# Altium schematic sheet 1.DSP.SchDoc
size A3; Date: 2019/03/06; Author: ZhangPan; Revision: 2.0; SheetNumber: 1; SheetTotal: 4; Size: A4; Contact: 0731-88731029
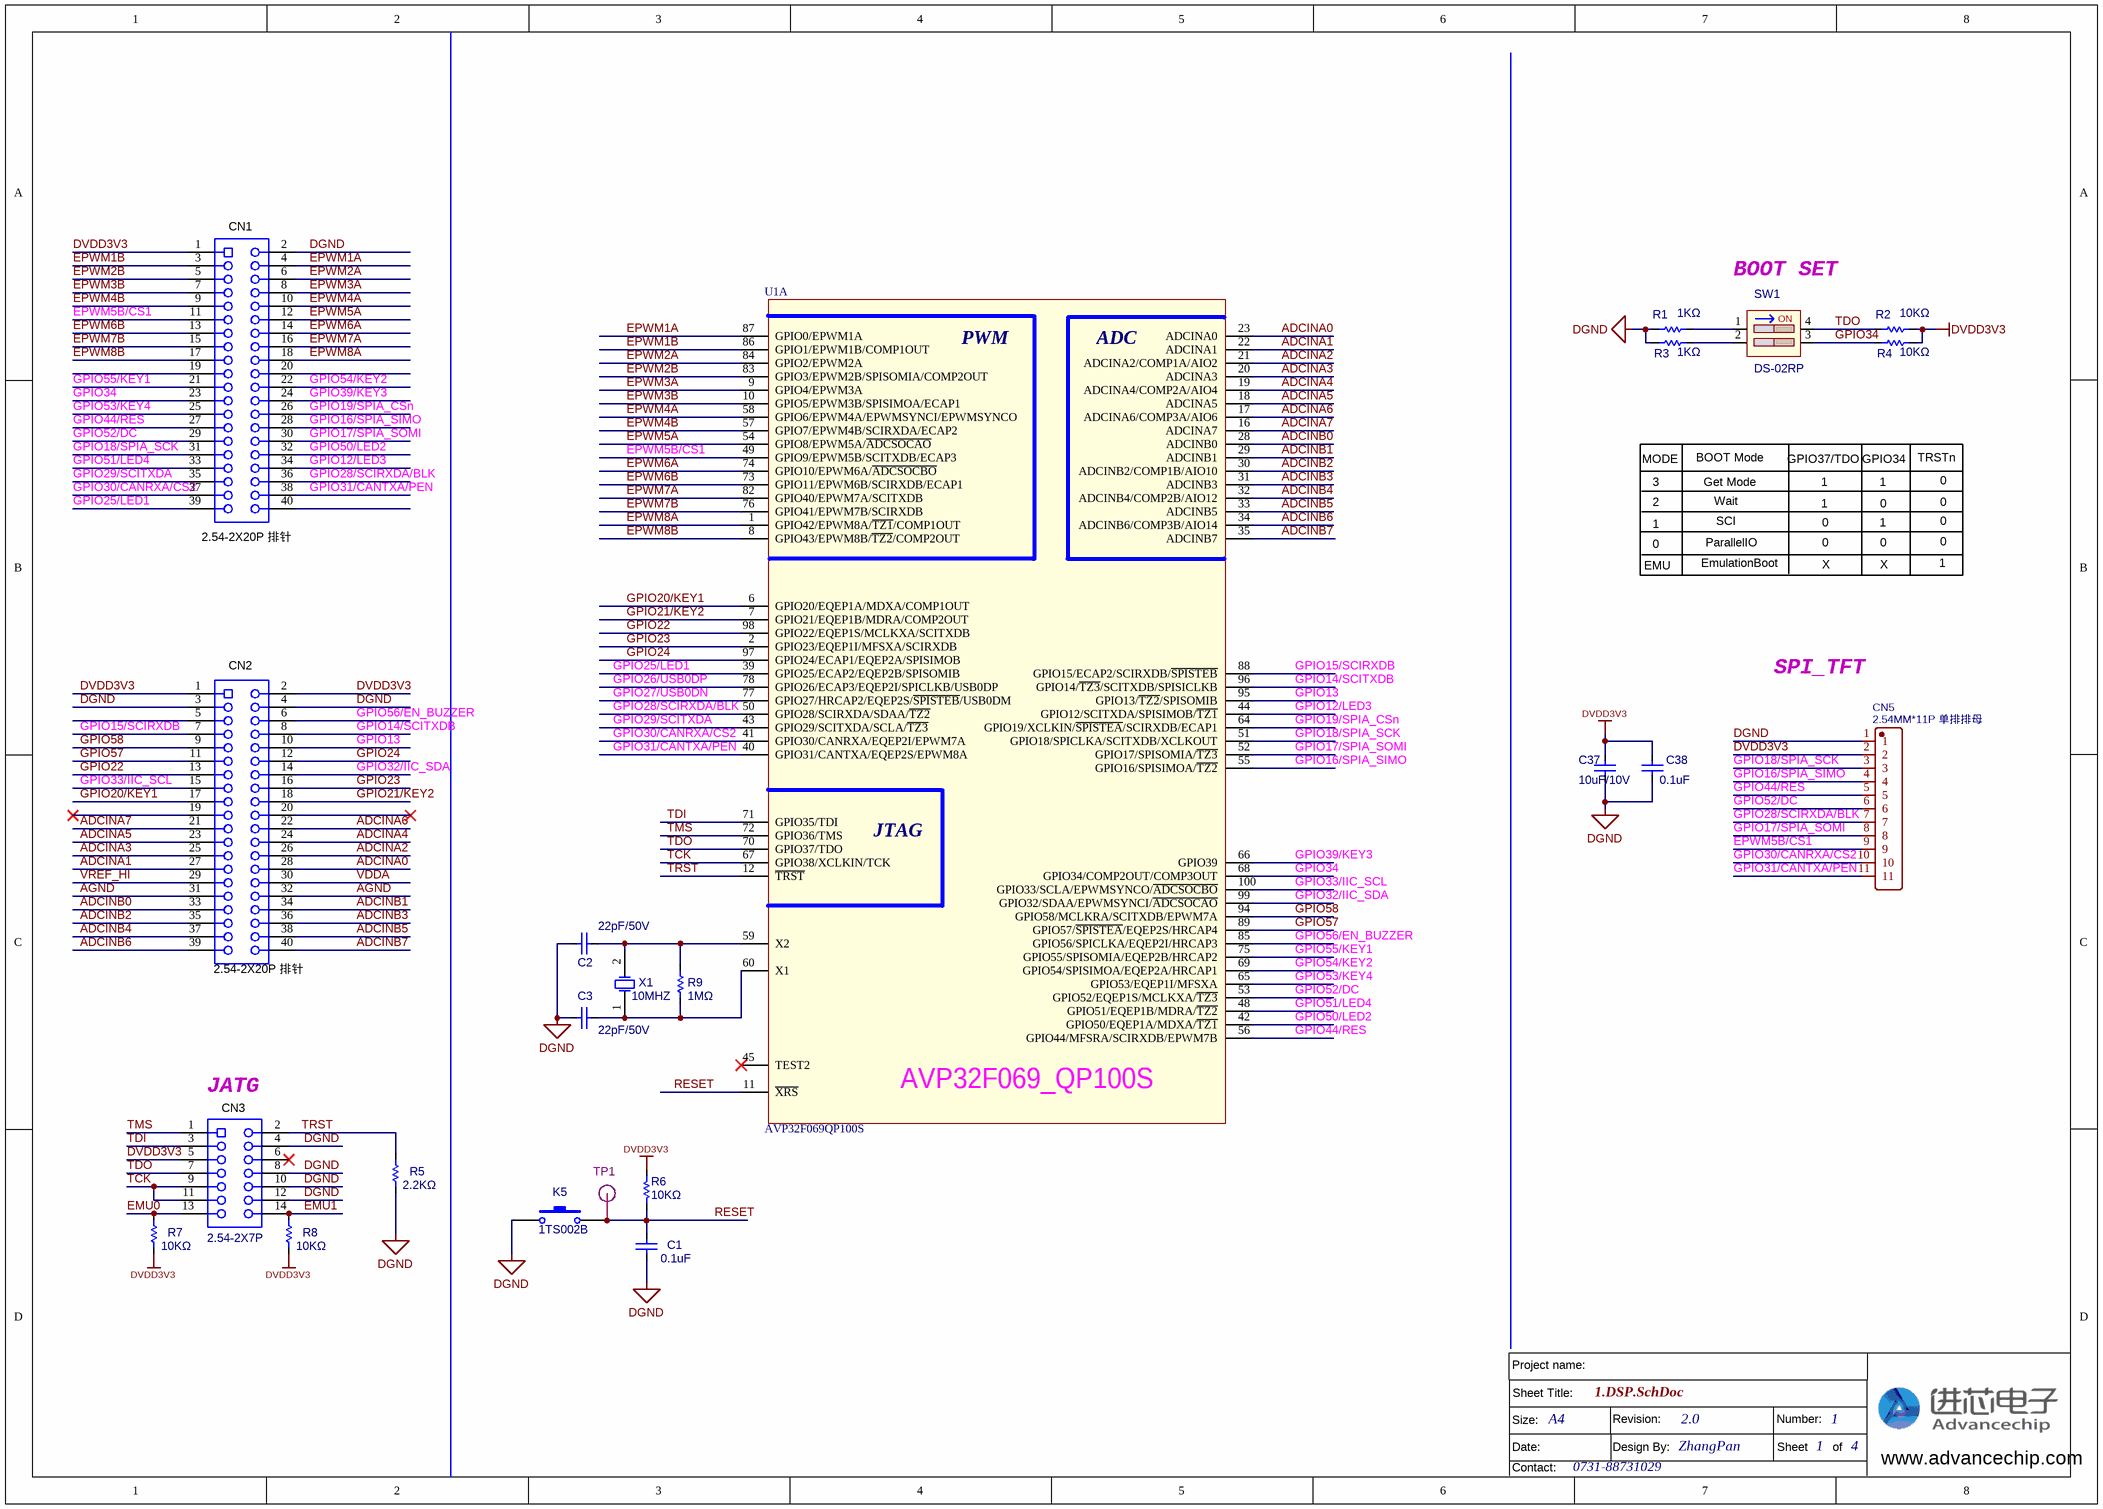
[diagram p0: 1.DSP.SchDoc]

## Parts
C1  value 0.1uF  [C0603]  (hidden comment: 0.1uF/50V)
C2  22pF/50V  [C0603]
C3  22pF/50V  [C0603]
C37  10uF/10V  [C0805]
C38  value 0.1uF  [C0603]  (hidden comment: 0.1uF/50V)
CN1  2.54-2X20P 排针  [IDC2X20]
CN2  2.54-2X20P 排针  [IDC2X20]
CN3  value 2.54-2X7P  [IDC14-L]  (hidden comment: 2.54-2X7P 简易牛角母座)
CN5  2.54MM*11P 单排排母  [SIP11_TFT]
K5  value 1TS002B  [SW-3X6]  (hidden comment: 1TS002B-2400-5001-CT)
R1  1KΩ  [R0603]
R2  10KΩ  [R0603]
R3  1KΩ  [R0603]
R4  10KΩ  [R0603]
R5  2.2KΩ  [R0603]
R6  10KΩ  [R0603]
R7  10KΩ  [R0603]
R8  10KΩ  [R0603]
R9  1MΩ  [R0603]
SW1  DS-02RP  [DIP-KEY-2]
TP1  RST  [TEST-0.8/1.5MM]  (value not drawn)
U1  AVP32F069QP100S  [LQFP-100]  (part A of 2)
X1  value 10MHZ  [XTAL_5032]  (hidden comment: YSX530GA 10MHZ 20pF 10ppm)

## Nets
DGND: C1.2 C2.2 C3.1 C37.2 C38.2 CN1.2 CN2.3 CN2.4 CN3.4 CN3.8 CN3.10 CN3.12 CN5.1 K5.2 R1.1 R3.1 R5.1
DVDD3V3: C37.1 C38.1 CN1.1 CN2.1 CN2.2 CN3.5 CN5.2 R2.2 R4.2 R6.1 R7.1 R8.1
ADCINA0: CN2.28 U1.23(ADCINA0)
ADCINA1: CN2.27 U1.22(ADCINA1)
ADCINA2: CN2.26 U1.21(ADCINA2/COMP1A/AIO2)
ADCINA3: CN2.25 U1.20(ADCINA3)
ADCINA4: CN2.24 U1.19(ADCINA4/COMP2A/AIO4)
ADCINA5: CN2.23 U1.18(ADCINA5)
ADCINA6: CN2.22 U1.17(ADCINA6/COMP3A/AIO6)
ADCINA7: CN2.21 U1.16(ADCINA7)
ADCINB0: CN2.33 U1.28(ADCINB0)
ADCINB1: CN2.34 U1.29(ADCINB1)
ADCINB2: CN2.35 U1.30(ADCINB2/COMP1B/AIO10)
ADCINB3: CN2.36 U1.31(ADCINB3)
ADCINB4: CN2.37 U1.32(ADCINB4/COMP2B/AIO12)
ADCINB5: CN2.38 U1.33(ADCINB5)
ADCINB6: CN2.39 U1.34(ADCINB6/COMP3B/AIO14)
ADCINB7: CN2.40 U1.35(ADCINB7)
AGND: CN2.31 CN2.32
EMU0: CN3.13 R7.2
EMU1: CN3.14 R8.2
EPWM1A: CN1.4 U1.87(GPIO0/EPWM1A)
EPWM1B: CN1.3 U1.86(GPIO1/EPWM1B/COMP1OUT)
EPWM2A: CN1.6 U1.84(GPIO2/EPWM2A)
EPWM2B: CN1.5 U1.83(GPIO3/EPWM2B/SPISOMIA/COMP2OUT)
EPWM3A: CN1.8 U1.9(GPIO4/EPWM3A)
EPWM3B: CN1.7 U1.10(GPIO5/EPWM3B/SPISIMOA/ECAP1)
EPWM4A: CN1.10 U1.58(GPIO6/EPWM4A/EPWMSYNCI/EPWMSYNCO)
EPWM4B: CN1.9 U1.57(GPIO7/EPWM4B/SCIRXDA/ECAP2)
EPWM5A: CN1.12 U1.54(GPIO8/EPWM5A/~{ADCSOCAO})
EPWM5B/CS1: CN1.11 CN5.9 U1.49(GPIO9/EPWM5B/SCITXDB/ECAP3)
EPWM6A: CN1.14 U1.74(GPIO10/EPWM6A/~{ADCSOCBO})
EPWM6B: CN1.13 U1.73(GPIO11/EPWM6B/SCIRXDB/ECAP1)
EPWM7A: CN1.16 U1.82(GPIO40/EPWM7A/SCITXDB)
EPWM7B: CN1.15 U1.76(GPIO41/EPWM7B/SCIRXDB)
EPWM8A: CN1.18 U1.1(GPIO42/EPWM8A/~{TZ1}/COMP1OUT)
EPWM8B: CN1.17 U1.8(GPIO43/EPWM8B/~{TZ2}/COMP2OUT)
GPIO12/LED3: CN1.34 U1.44(GPIO12/SCITXDA/SPISIMOB/~{TZ1})
GPIO13: CN2.10 U1.95(GPIO13/~{TZ2}/SPISOMIB)
GPIO14/SCITXDB: CN2.8 U1.96(GPIO14/~{TZ3}/SCITXDB/SPISICLKB)
GPIO15/SCIRXDB: CN2.7 U1.88(GPIO15/ECAP2/SCIRXDB/~{SPISTEB})
GPIO16/SPIA_SIMO: CN1.28 CN5.4 U1.55(GPIO16/SPISIMOA/~{TZ2})
GPIO17/SPIA_SOMI: CN1.30 CN5.8 U1.52(GPIO17/SPISOMIA/~{TZ3})
GPIO18/SPIA_SCK: CN1.31 CN5.3 U1.51(GPIO18/SPICLKA/SCITXDB/XCLKOUT)
GPIO19/SPIA_CSn: CN1.26 U1.64(GPIO19/XCLKIN/~{SPISTEA}/SCIRXDB/ECAP1)
GPIO20/KEY1: CN2.17 U1.6(GPIO20/EQEP1A/MDXA/COMP1OUT)
GPIO21/KEY2: CN2.18 U1.7(GPIO21/EQEP1B/MDRA/COMP2OUT)
GPIO22: CN2.13 U1.98(GPIO22/EQEP1S/MCLKXA/SCITXDB)
GPIO23: CN2.16 U1.2(GPIO23/EQEP1I/MFSXA/SCIRXDB)
GPIO24: CN2.12 U1.97(GPIO24/ECAP1/EQEP2A/SPISIMOB)
GPIO25/LED1: CN1.39 U1.39(GPIO25/ECAP2/EQEP2B/SPISOMIB)
GPIO26/USB0DP: U1.78(GPIO26/ECAP3/EQEP2I/SPICLKB/USB0DP)
GPIO27/USB0DN: U1.77(GPIO27/HRCAP2/EQEP2S/~{SPISTEB}/USB0DM)
GPIO28/SCIRXDA/BLK: CN1.36 CN5.7 U1.50(GPIO28/SCIRXDA/SDAA/~{TZ2})
GPIO29/SCITXDA: CN1.35 U1.43(GPIO29/SCITXDA/SCLA/~{TZ3})
GPIO30/CANRXA/CS2: CN1.37 CN5.10 U1.41(GPIO30/CANRXA/EQEP2I/EPWM7A)
GPIO31/CANTXA/PEN: CN1.38 CN5.11 U1.40(GPIO31/CANTXA/EQEP2S/EPWM8A)
GPIO32/IIC_SDA: CN2.14 U1.99(GPIO32/SDAA/EPWMSYNCI/~{ADCSOCAO})
GPIO33/IIC_SCL: CN2.15 U1.100(GPIO33/SCLA/EPWMSYNCO/~{ADCSOCBO})
GPIO34: CN1.23 R4.1 SW1.3 U1.68(GPIO34/COMP2OUT/COMP3OUT)
GPIO39/KEY3: CN1.24 U1.66(GPIO39)
GPIO44/RES: CN1.27 CN5.5 U1.56(GPIO44/MFSRA/SCIRXDB/EPWM7B)
GPIO50/LED2: CN1.32 U1.42(GPIO50/EQEP1A/MDXA/~{TZ1})
GPIO51/LED4: CN1.33 U1.48(GPIO51/EQEP1B/MDRA/~{TZ2})
GPIO52/DC: CN1.29 CN5.6 U1.53(GPIO52/EQEP1S/MCLKXA/~{TZ3})
GPIO53/KEY4: CN1.25 U1.65(GPIO53/EQEP1I/MFSXA)
GPIO54/KEY2: CN1.22 U1.69(GPIO54/SPISIMOA/EQEP2A/HRCAP1)
GPIO55/KEY1: CN1.21 U1.75(GPIO55/SPISOMIA/EQEP2B/HRCAP2)
GPIO56/EN_BUZZER: CN2.6 U1.85(GPIO56/SPICLKA/EQEP2I/HRCAP3)
GPIO57: CN2.11 U1.89(GPIO57/~{SPISTEA}/EQEP2S/HRCAP4)
GPIO58: CN2.9 U1.94(GPIO58/MCLKRA/SCITXDB/EPWM7A)
RESET: C1.1 K5.1 R6.2 TP1.1 U1.11(~{XRS})
TCK: CN3.9 CN3.11 U1.67(GPIO38/XCLKIN/TCK)
TDI: CN3.3 U1.71(GPIO35/TDI)
TDO: CN3.7 R2.1 SW1.4 U1.70(GPIO37/TDO)
TMS: CN3.1 U1.72(GPIO36/TMS)
TRST: CN3.2 R5.2 U1.12(~{TRST})
VDDA: CN2.30
VREF_HI: CN2.29
NetC2_1: C2.1 R9.1 U1.59(X2) X1.2(OSC2)
NetC3_2: C3.2 R9.2 U1.60(X1) X1.1(OSC1)
NetR1_2: R1.2 SW1.1
NetR3_2: R3.2 SW1.2

Not connected (* = marked no-connect by the designer): CN1 19 20 40; CN2 5 19* 20*; CN3 6*; U1 45(TEST2)*

## Notes on the sheet
- BOOT SET
- BOOT Mode
- TRSTn
- 3
- 2
- 1
- MODE
- Wait
- SCI
- Get Mode
- GPIO37/TDO
- 0
- GPIO34
- EMU
- ParallelIO
- EmulationBoot
- X
- SPI_TFT
- (near CN3) JATG
- Sheet Title:
- Project name:
- Size:
- Date:
- Contact:
- Revision:
- Design By:
- Number:
- Sheet       of
- www.advancechip.com
- (in symbol AVP32F069QP100S, part A) PWM; ADC; JTAG; AVP32F069_QP100S
- (in symbol SW-2B) ON

## Library data of the parts
C1 C37 C38 = Cap: 贴片电容; Published: 8-Jun-2000; LatestRevisionDate: 17-Jul-2002; LatestRevisionNote: Re-released for DXP Platform.; Publisher: Altium Limited
  C37: Value: 10uF/10V
C2 C3 = Cap: COG贴片电容; Value: 100pF; Published: 8-Jun-2000; LatestRevisionDate: 17-Jul-2002; LatestRevisionNote: Re-released for DXP Platform.; Publisher: Altium Limited
CN1 CN2 = CON 20X2A: 连接器
CN3 = Receptacle_7X2: 连接器
CN5 = KH-2.54FH-1X11P-H8.5: 连接器; BOM_Manufacturer: kinghelm(金航标); Contributor: LCSC; BOM_Supplier: LCSC; BOM_Supplier Part: C2932674; BOM_Manufacturer Part: KH-2.54FH-1X11P-H8.5; spicePre: U; spiceSymbolName: KH-2.54FH-1X11P-H8.5
K5 = SW-PB: 鸿源精密轻触开关3X6; Published: 24-Mar-1999; LatestRevisionDate: 17-Jul-2002; LatestRevisionNote: Re-released for DXP Platform.; Publisher: Altium Limited
R1-R9 = Res: 贴片电阻; Value: 1K; Published: 8-Jun-2000; LatestRevisionDate: 17-Jul-2002; LatestRevisionNote: Re-released for DXP Platform.; Publisher: Altium Limited
SW1 = SW-2B: 红色2PIN-2.54mm立式直插正拨拨码开关; Published: 24-Mar-1999; LatestRevisionDate: 17-Jul-2002; LatestRevisionNote: Re-released for DXP Platform.; Publisher: Altium Limited
TP1 = TP: 测试点
U1 = AVP32F069QP100S: 进芯32位浮点DSP
X1 = XTAL: 5032贴片无源晶振; Published: 8-Jun-2000; LatestRevisionDate: 17-Jul-2002; LatestRevisionNote: Re-released for DXP Platform.; Publisher: Altium Limited